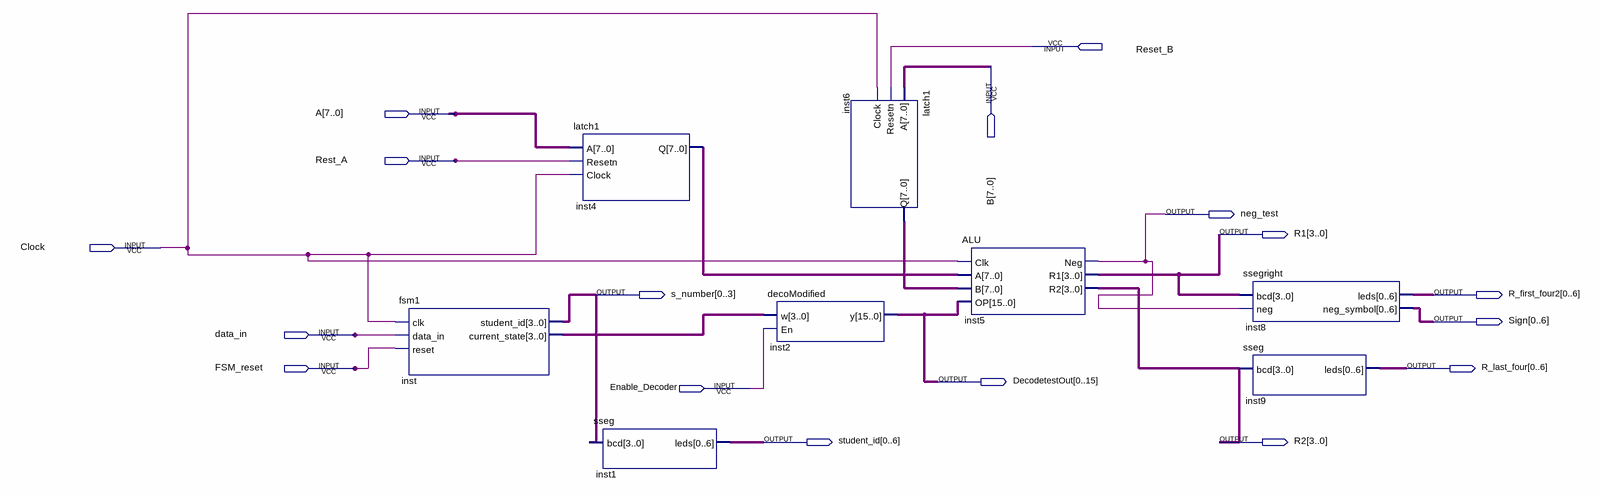
[diagram p0: schematic sheet]
// Quartus schematic problem1.bdf as structural Verilog: 8 symbols, 17 pins
module problem1 (
  input  Reset_B,
  input  [7:0] B,
  input  [7:0] A,
  input  Rest_A,
  input  Clock,
  input  data_in,
  input  FSM_reset,
  input  Enable_Decoder,
  output neg_test,
  output [3:0] R1,
  output [0:3] s_number,
  output [0:6] R_first_four2,
  output [0:6] Sign,
  output [0:6] R_last_four,
  output [0:15] DecodetestOut,
  output [0:6] student_id,
  output [3:0] R2
);

  wire [3:0] inst_current_state;
  wire [7:0] inst4_q, inst6_q;

  fsm1 inst (
    .clk(Clock), .data_in(data_in), .reset(FSM_reset), .student_id(s_number),
    .current_state(inst_current_state));
  latch1 inst4 (.A(A), .Resetn(Rest_A), .Clock(Clock), .Q(inst4_q));
  sseg inst1 (.bcd(s_number), .leds(student_id));
  decoModified inst2 (.w(inst_current_state), .En(Enable_Decoder), .y(DecodetestOut));
  latch1 inst6 (.A(B), .Resetn(Reset_B), .Clock(Clock), .Q(inst6_q));
  ALU inst5 (.Clk(Clock), .A(inst4_q), .B(inst6_q), .OP(DecodetestOut), .Neg(neg_test), .R1(R1), .R2(R2));
  ssegright inst8 (.bcd(R1), .neg(neg_test), .leds(R_first_four2), .neg_symbol(Sign));
  sseg inst9 (.bcd(R2), .leds(R_last_four));
endmodule
